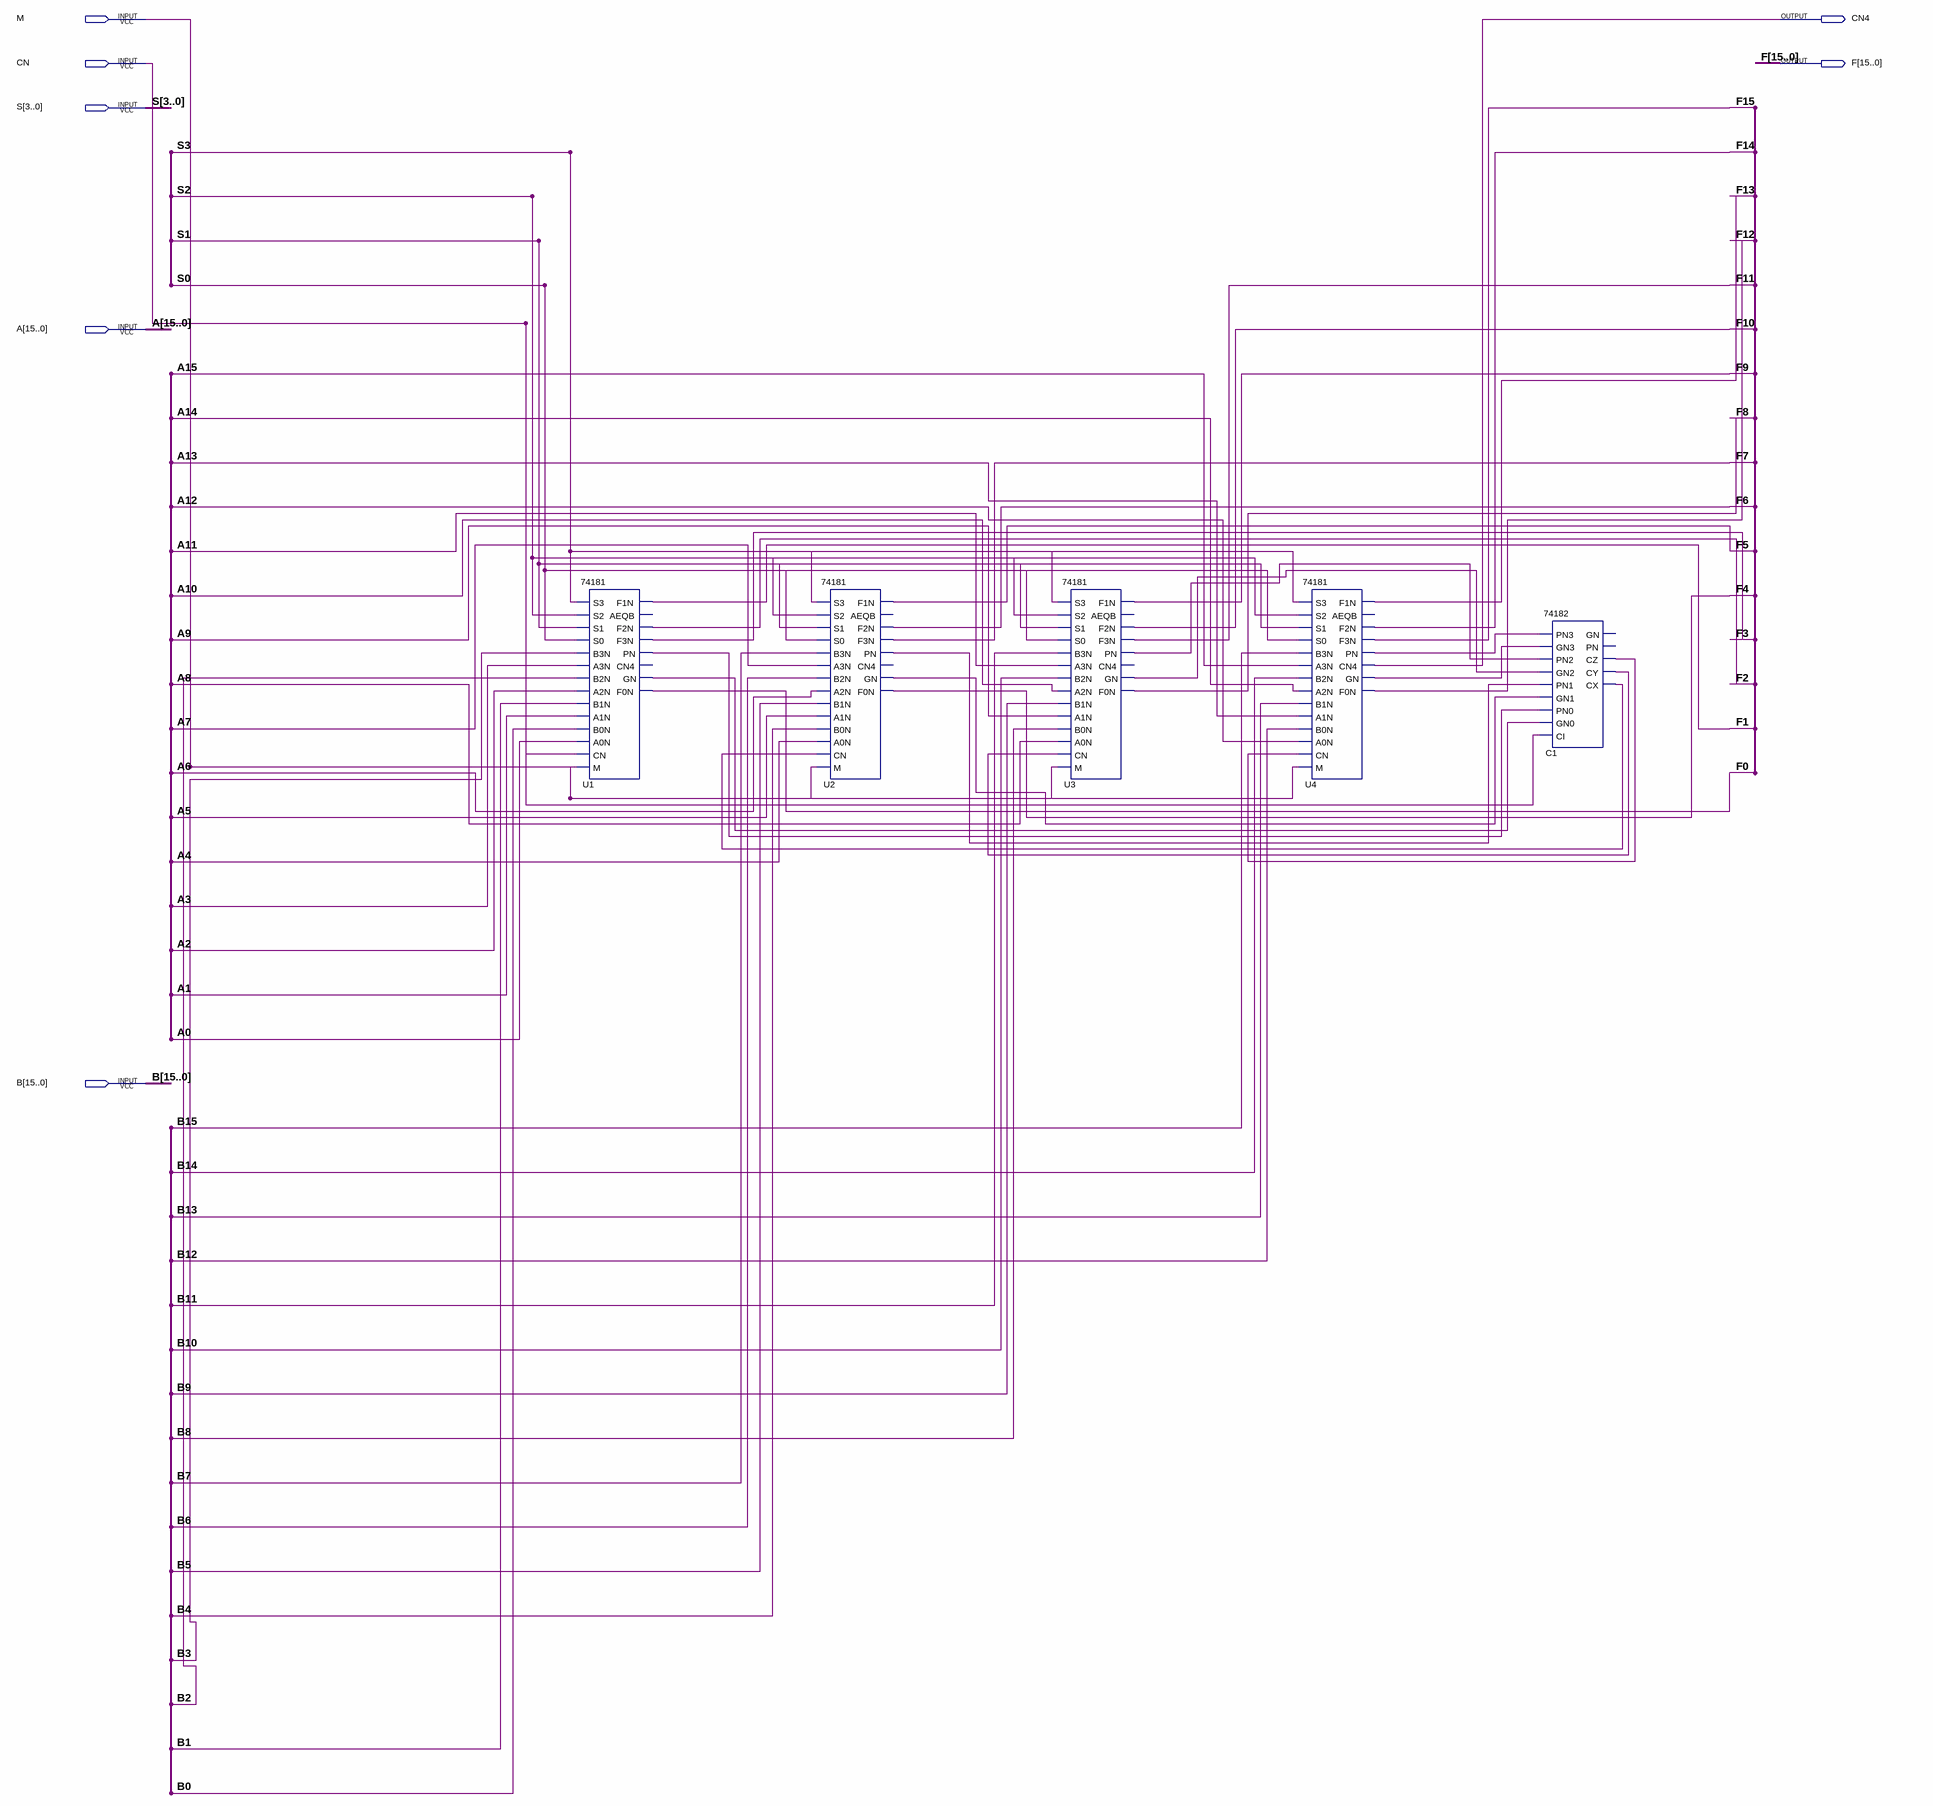
[diagram p0: schematic sheet]
// Quartus schematic alu16la.bdf as structural Verilog: 5 symbols, 7 pins
module alu16la (
  input  M,
  input  CN,
  input  [3:0] S,
  input  [15:0] A,
  input  [15:0] B,
  output CN4,
  output [15:0] F
);

  wire C1_cx, C1_cy, C1_cz, U1_gn, U1_pn, U2_gn, U2_pn, U3_gn, U3_pn, U4_gn, U4_pn;

  \74181  U1 (
    .S3(S[3]), .S2(S[2]), .S1(S[1]), .S0(S[0]), .B3N(B[3]), .A3N(A[3]), .B2N(B[2]), .A2N(A[2]), .B1N(B[1]),
    .A1N(A[1]), .B0N(B[0]), .A0N(A[0]), .CN(CN), .M(M), .F1N(F[1]), .F2N(F[2]), .F3N(F[3]), .PN(U1_pn),
    .GN(U1_gn), .F0N(F[0]));  // open: AEQB, CN4
  \74181  U2 (
    .S3(S[3]), .S2(S[2]), .S1(S[1]), .S0(S[0]), .B3N(B[7]), .A3N(A[7]), .B2N(B[6]), .A2N(A[6]), .B1N(B[5]),
    .A1N(A[5]), .B0N(B[4]), .A0N(A[4]), .CN(C1_cx), .M(M), .F1N(F[5]), .F2N(F[6]), .F3N(F[7]), .PN(U2_pn),
    .GN(U2_gn), .F0N(F[4]));  // open: AEQB, CN4
  \74181  U3 (
    .S3(S[3]), .S2(S[2]), .S1(S[1]), .S0(S[0]), .B3N(B[11]), .A3N(A[11]), .B2N(B[10]), .A2N(A[10]),
    .B1N(B[9]), .A1N(A[9]), .B0N(B[8]), .A0N(A[8]), .CN(C1_cy), .M(M), .F1N(F[9]), .F2N(F[10]), .F3N(F[11]),
    .PN(U3_pn), .GN(U3_gn), .F0N(F[8]));  // open: AEQB, CN4
  \74181  U4 (
    .S3(S[3]), .S2(S[2]), .S1(S[1]), .S0(S[0]), .B3N(B[15]), .A3N(A[15]), .B2N(B[14]), .A2N(A[14]),
    .B1N(B[13]), .A1N(A[13]), .B0N(B[12]), .A0N(A[12]), .CN(C1_cz), .M(M), .F1N(F[13]), .F2N(F[14]),
    .F3N(F[15]), .PN(U4_pn), .CN4(CN4), .GN(U4_gn), .F0N(F[12]));  // open: AEQB
  \74182  C1 (
    .PN3(U4_pn), .GN3(U4_gn), .PN2(U3_pn), .GN2(U3_gn), .PN1(U2_pn), .GN1(U2_gn), .PN0(U1_pn), .GN0(U1_gn),
    .CI(CN), .CZ(C1_cz), .CY(C1_cy), .CX(C1_cx));  // open: GN, PN
endmodule
